# Altium schematic sheet 3_IO.SchDoc
size 383 x 325 mm; SheetNumber: 2; SheetTotal: 4
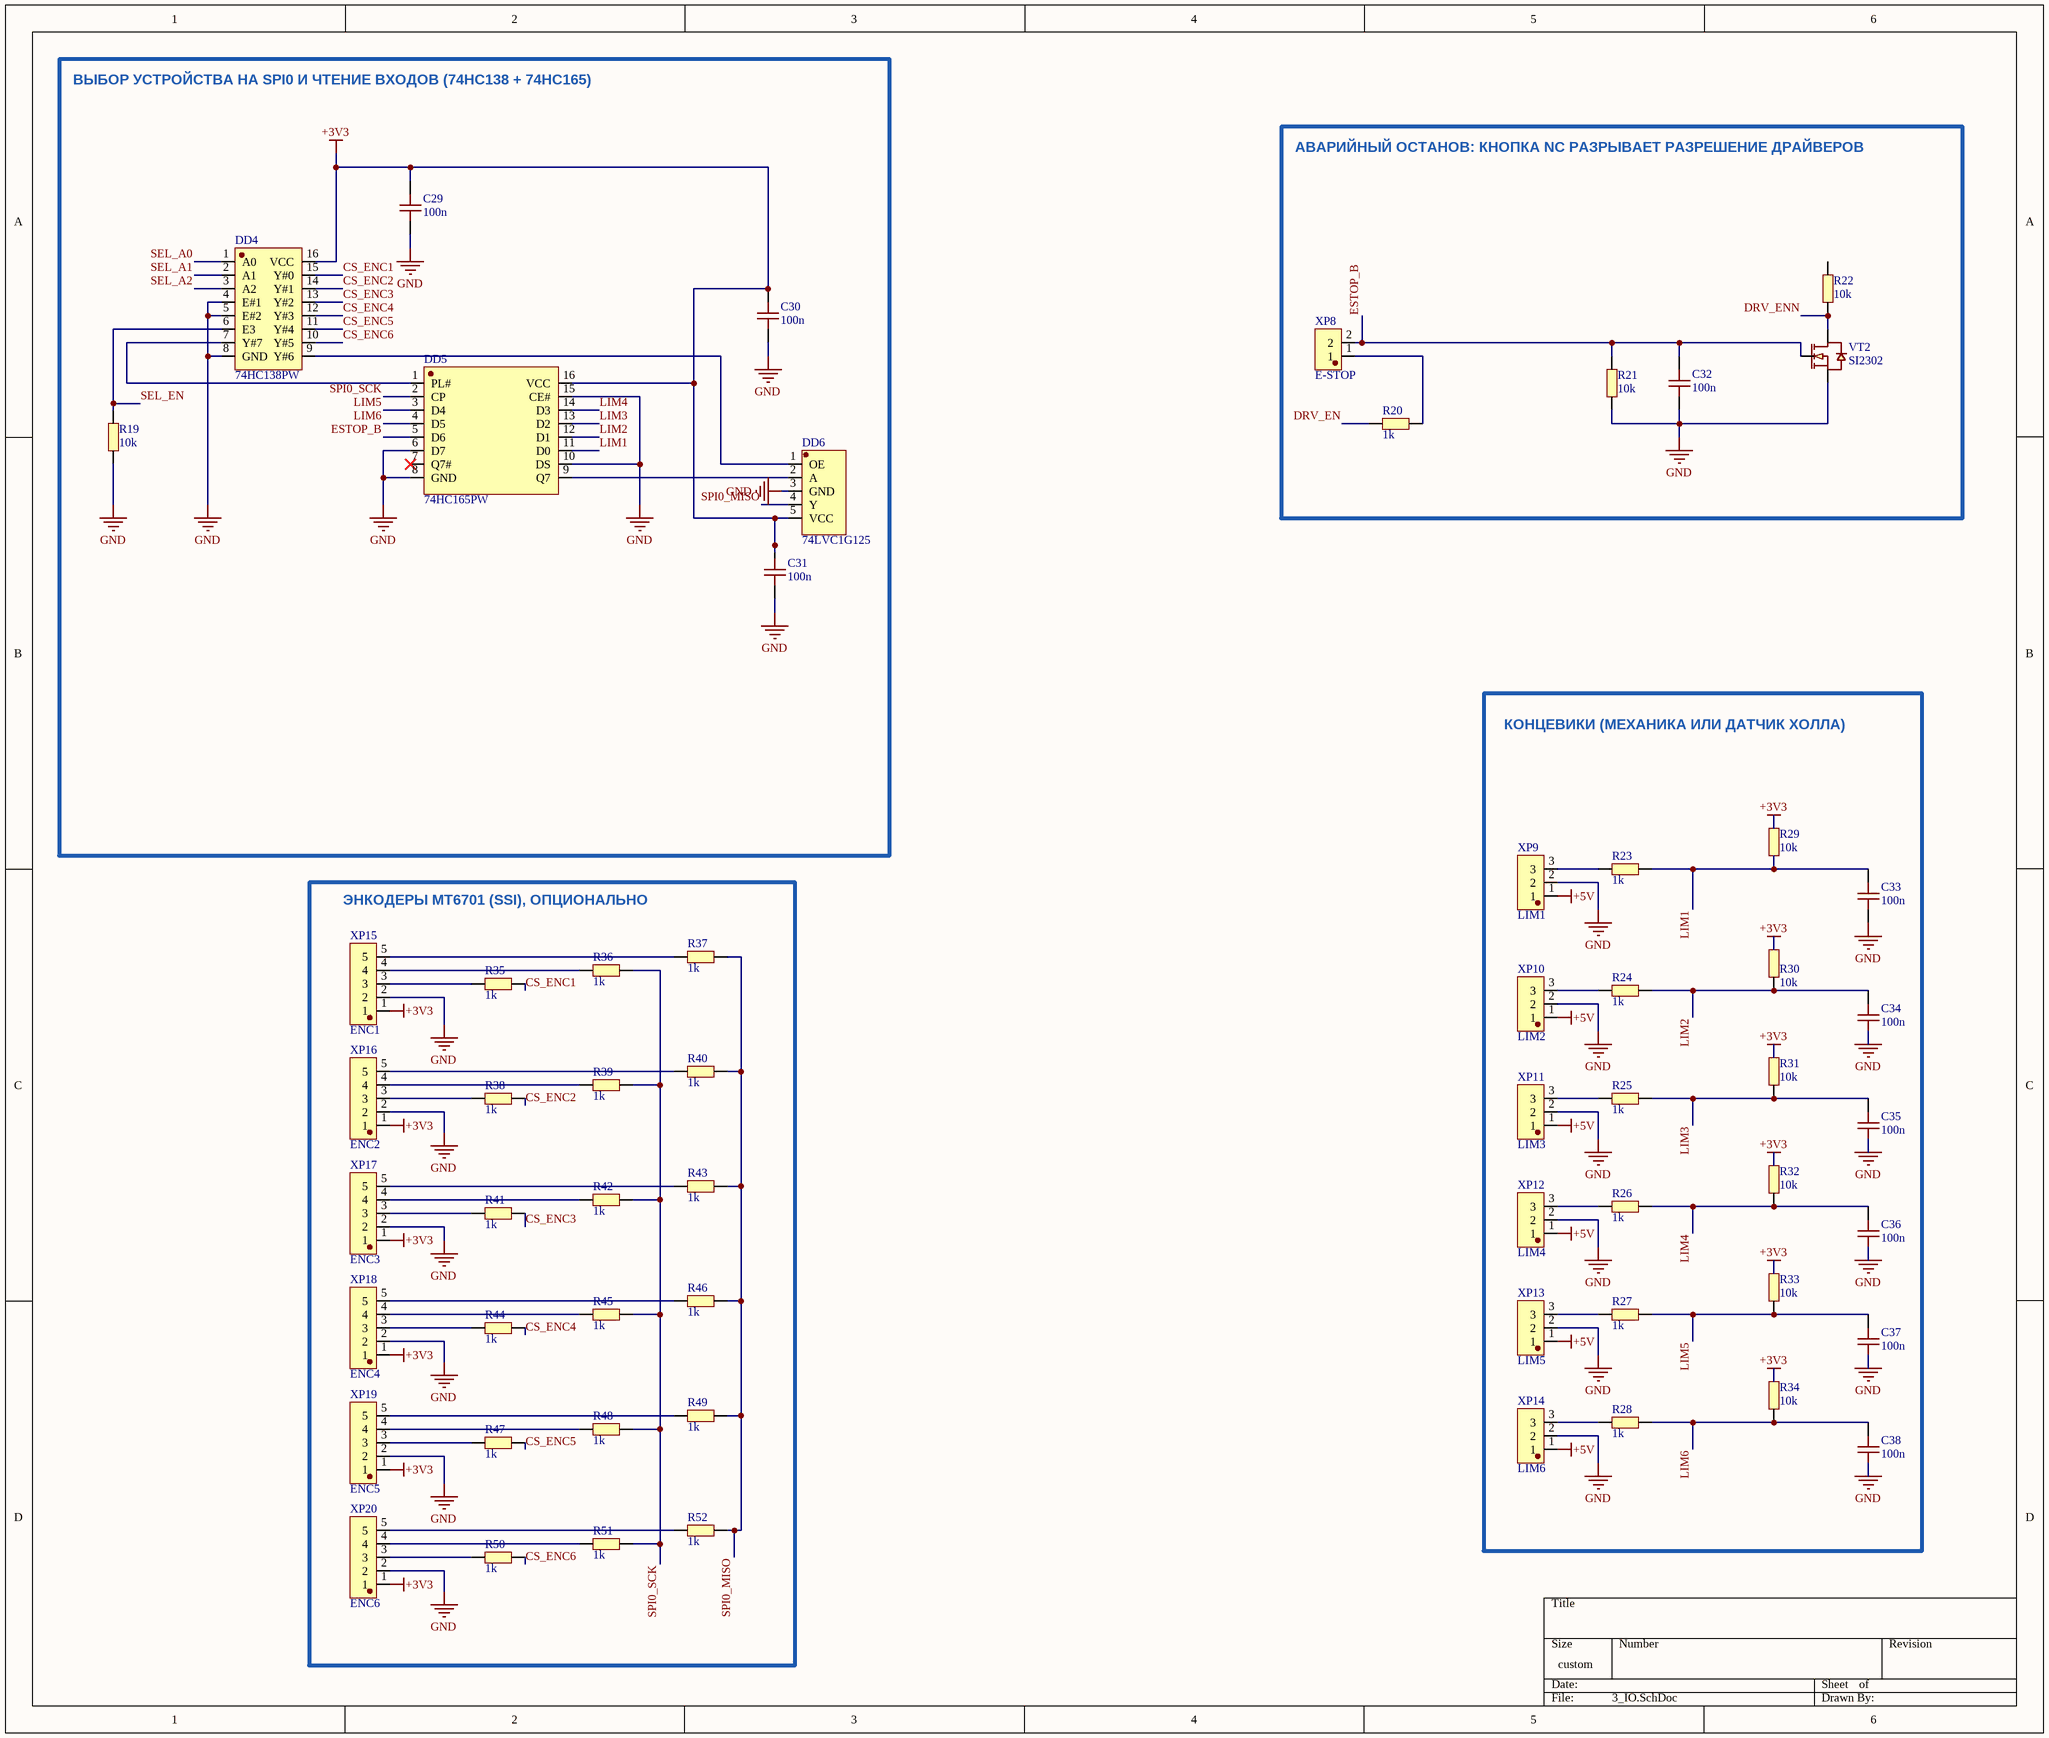
[diagram p0: 3_IO.SchDoc]

## Parts
C29  100n  [C0603]
C30  100n  [C0603]
C31  100n  [C0603]
C32  100n  [C0603]
C33  100n  [C0603]
C34  100n  [C0603]
C35  100n  [C0603]
C36  100n  [C0603]
C37  100n  [C0603]
C38  100n  [C0603]
DD4  74HC138PW  [TSSOP-16_L5.0-W4.4-P0.65-LS6.4-BL]
DD5  74HC165PW  [TSSOP-16_L5.0-W4.4-P0.65-LS6.4-BL]
DD6  74LVC1G125  [SOT-23-5_L3.0-W1.7-P0.95-LS2.8-BL]
R19  10k  [R0603]
R20  1k  [R0603]
R21  10k  [R0603]
R22  10k  [R0603]
R23  1k  [R0603]
R24  1k  [R0603]
R25  1k  [R0603]
R26  1k  [R0603]
R27  1k  [R0603]
R28  1k  [R0603]
R29  10k  [R0603]
R30  10k  [R0603]
R31  10k  [R0603]
R32  10k  [R0603]
R33  10k  [R0603]
R34  10k  [R0603]
R35  1k  [R0603]
R36  1k  [R0603]
R37  1k  [R0603]
R38  1k  [R0603]
R39  1k  [R0603]
R40  1k  [R0603]
R41  1k  [R0603]
R42  1k  [R0603]
R43  1k  [R0603]
R44  1k  [R0603]
R45  1k  [R0603]
R46  1k  [R0603]
R47  1k  [R0603]
R48  1k  [R0603]
R49  1k  [R0603]
R50  1k  [R0603]
R51  1k  [R0603]
R52  1k  [R0603]
VT2  SI2302  [SOT-23-3_L2.9-W1.3-P1.90-LS2.4-BR-CW]
XP8  E-STOP  [HDR-TH_2P-P2.54-V-M]
XP9  LIM1  [HDR-TH_3P-P2.54-V-M_PZ254V-11-03P]
XP10  LIM2  [HDR-TH_3P-P2.54-V-M_PZ254V-11-03P]
XP11  LIM3  [HDR-TH_3P-P2.54-V-M_PZ254V-11-03P]
XP12  LIM4  [HDR-TH_3P-P2.54-V-M_PZ254V-11-03P]
XP13  LIM5  [HDR-TH_3P-P2.54-V-M_PZ254V-11-03P]
XP14  LIM6  [HDR-TH_3P-P2.54-V-M_PZ254V-11-03P]
XP15  ENC1  [HDR-TH_5P-P2.54-V-M]
XP16  ENC2  [HDR-TH_5P-P2.54-V-M]
XP17  ENC3  [HDR-TH_5P-P2.54-V-M]
XP18  ENC4  [HDR-TH_5P-P2.54-V-M]
XP19  ENC5  [HDR-TH_5P-P2.54-V-M]
XP20  ENC6  [HDR-TH_5P-P2.54-V-M]

## Blocks framed on the sheet
ВЫБОР УСТРОЙСТВА НА SPI0 И ЧТЕНИЕ ВХОДОВ (74HC138 + 74HC165): C29-C31 DD4-DD6 R19
АВАРИЙНЫЙ ОСТАНОВ: КНОПКА NC РАЗРЫВАЕТ РАЗРЕШЕНИЕ ДРАЙВЕРОВ: C32 R20-R22 VT2 XP8
КОНЦЕВИКИ (МЕХАНИКА ИЛИ ДАТЧИК ХОЛЛА): C33-C38 R23-R34 XP9-XP14
ЭНКОДЕРЫ MT6701 (SSI), ОПЦИОНАЛЬНО: R35-R52 XP15-XP20

## Nets
+3V3: C29.1 C30.1 C31.1 DD4.16(VCC) DD5.16(VCC) DD6.5(VCC) R29.2 R30.2 R31.2 R32.2 R33.2 R34.2 XP15.1 XP16.1 XP17.1 XP18.1 XP19.1 XP20.1
+5V: XP9.1 XP10.1 XP11.1 XP12.1 XP13.1 XP14.1
GND: C29.2 C30.2 C31.2 C32.2 C33.2 C34.2 C35.2 C36.2 C37.2 C38.2 DD4.4(E#1) DD4.5(E#2) DD4.8(GND) DD5.6(D7) DD5.8(GND) DD5.10(DS) DD5.15(CE#) DD6.3(GND) R19.2 R21.2 VT2.3(S) XP9.2 XP10.2 XP11.2 XP12.2 XP13.2 XP14.2 XP15.2 XP16.2 XP17.2 XP18.2 XP19.2 XP20.2
CS_ENC1: DD4.15(Y#0) R35.2
CS_ENC2: DD4.14(Y#1) R38.2
CS_ENC3: DD4.13(Y#2) R41.2
CS_ENC4: DD4.12(Y#3) R44.2
CS_ENC5: DD4.11(Y#4) R47.2
CS_ENC6: DD4.10(Y#5) R50.2
DRV_EN: R20.1
DRV_ENN: R22.1 VT2.2(D)
ESTOP_B: C32.1 DD5.5(D6) R21.1 VT2.1(G) XP8.2
LIM1: C33.1 DD5.11(D0) R23.2 R29.1
LIM2: C34.1 DD5.12(D1) R24.2 R30.1
LIM3: C35.1 DD5.13(D2) R25.2 R31.1
LIM4: C36.1 DD5.14(D3) R26.2 R32.1
LIM5: C37.1 DD5.3(D4) R27.2 R33.1
LIM6: C38.1 DD5.4(D5) R28.2 R34.1
SEL_A0: DD4.1(A0)
SEL_A1: DD4.2(A1)
SEL_A2: DD4.3(A2)
SEL_EN: DD4.6(E3) R19.1
SPI0_MISO: DD6.4(Y) R37.2 R40.2 R43.2 R46.2 R49.2 R52.2
SPI0_SCK: DD5.2(CP) R36.2 R39.2 R42.2 R45.2 R48.2 R51.2
NetDD4_7: DD4.7(Y#7) DD5.1(PL#)
NetDD4_9: DD4.9(Y#6) DD6.1(OE)
NetDD5_9: DD5.9(Q7) DD6.2(A)
NetR20_2: R20.2 XP8.1
NetR23_1: R23.1 XP9.3
NetR24_1: R24.1 XP10.3
NetR25_1: R25.1 XP11.3
NetR26_1: R26.1 XP12.3
NetR27_1: R27.1 XP13.3
NetR28_1: R28.1 XP14.3
NetR35_1: R35.1 XP15.3
NetR36_1: R36.1 XP15.4
NetR37_1: R37.1 XP15.5
NetR38_1: R38.1 XP16.3
NetR39_1: R39.1 XP16.4
NetR40_1: R40.1 XP16.5
NetR41_1: R41.1 XP17.3
NetR42_1: R42.1 XP17.4
NetR43_1: R43.1 XP17.5
NetR44_1: R44.1 XP18.3
NetR45_1: R45.1 XP18.4
NetR46_1: R46.1 XP18.5
NetR47_1: R47.1 XP19.3
NetR48_1: R48.1 XP19.4
NetR49_1: R49.1 XP19.5
NetR50_1: R50.1 XP20.3
NetR51_1: R51.1 XP20.4
NetR52_1: R52.1 XP20.5

Not connected (* = marked no-connect by the designer): DD5 7(Q7#)*; R22 2

## Library data of the parts
C29-C38 = CL10B104KB8NNNC/0603: Manufacturer Part Number: CL10B104KB8NNNC/0603; LCSC Part: C9900007620; Supplier: LCSC; Supplier Part Number: C9900007620; Datasheet: https://www.lcsc.com/datasheet/C9900007620.pdf; Source: JLCEDA/EasyEDA Official Library (https://easyeda.com, https://lceda.cn)
DD4 = 74HC138PW-Q100,118: Manufacturer: Nexperia; Manufacturer Part Number: 74HC138PW-Q100,118; LCSC Part: C546575; Supplier: LCSC; Supplier Part Number: C546575; JLCPCB Part Class: Extended Part; Datasheet: https://www.lcsc.com/datasheet/C546575.pdf; LCSC URL: https://lcsc.com/product-detail/presales_Nexperia-74HC138PW-Q100-118_C546575.html; Source: JLCEDA/EasyEDA Official Library (https://easyeda.com, https://lceda.cn)
DD5 = 74HC165PW,118: Manufacturer: Nexperia; Manufacturer Part Number: 74HC165PW,118; LCSC Part: C80696; Supplier: LCSC; Supplier Part Number: C80696; JLCPCB Part Class: Extended Part; Datasheet: https://www.lcsc.com/datasheet/C80696.pdf; LCSC URL: https://lcsc.com/product-detail/74-Series_NXP_74HC165PW_74HC165PW_C80696.html; Source: JLCEDA/EasyEDA Official Library (https://easyeda.com, https://lceda.cn)
DD6 = SN74LVC1G125DBVR: Manufacturer: TI; Manufacturer Part Number: SN74LVC1G125DBVR; LCSC Part: C23654; Supplier: LCSC; Supplier Part Number: C23654; JLCPCB Part Class: Extended Part; Datasheet: https://www.lcsc.com/datasheet/C23654.pdf; LCSC URL: https://lcsc.com/product-detail/74-Series_TI_SN74LVC1G125DBVR_SN74LVC1G125DBVR_C23654.html; Source: JLCEDA/EasyEDA Official Library (https://easyeda.com, https://lceda.cn)
R19-R52 = 0603WAF1002T5E: 10KOhm (1002) ±1%; Manufacturer: UNI-ROYAL; Value: 10kΩ; Manufacturer Part Number: 0603WAF1002T5E; LCSC Part: C25804; Supplier: LCSC; Supplier Part Number: C25804; JLCPCB Part Class: Basic Part; Datasheet: https://www.lcsc.com/datasheet/C25804.pdf; LCSC URL: https://lcsc.com/product-detail/Chip-Resistor-Surface-Mount-UniOhm_10KR-1002-1_C25804.html; Source: JLCEDA/EasyEDA Official Library (https://easyeda.com, https://lceda.cn)
VT2 = SI2302DDS-T1-GE3-HXY: Manufacturer: HXY MOSFET; Manufacturer Part Number: Si2302DDS-T1-GE3-HXY; LCSC Part: C22367242; Supplier: LCSC; Supplier Part Number: C22367242; JLCPCB Part Class: Extended Part; Datasheet: https://www.lcsc.com/datasheet/C22367242.pdf; Source: JLCEDA/EasyEDA Official Library (https://easyeda.com, https://lceda.cn)
XP8 = PZ254V-11-02P: Manufacturer: XFCN; Manufacturer Part Number: PZ254V-11-02P; LCSC Part: C492401; Supplier: LCSC; Supplier Part Number: C492401; JLCPCB Part Class: Extended Part; Datasheet: https://www.lcsc.com/datasheet/C492401.pdf; LCSC URL: https://lcsc.com/product-detail/New-Arrivals_XFCN-PZ254V-11-02P_C492401.html; Source: JLCEDA/EasyEDA Official Library (https://easyeda.com, https://lceda.cn)
XP9-XP14 = PZ254V-11-03P_C2937625: Manufacturer: XFCN; Manufacturer Part Number: PZ254V-11-03P; LCSC Part: C2937625; Supplier: LCSC; Supplier Part Number: C2937625; JLCPCB Part Class: Extended Part; Datasheet: https://www.lcsc.com/datasheet/C2937625.pdf; Source: JLCEDA/EasyEDA Official Library (https://easyeda.com, https://lceda.cn)
XP15-XP20 = PZ254V-11-05P: Manufacturer: XFCN; Manufacturer Part Number: PZ254V-11-05P; LCSC Part: C492404; Supplier: LCSC; Supplier Part Number: C492404; JLCPCB Part Class: Extended Part; Datasheet: https://www.lcsc.com/datasheet/C492404.pdf; LCSC URL: https://lcsc.com/product-detail/New-Arrivals_XFCN-PZ254V-11-05P_C492404.html; Source: JLCEDA/EasyEDA Official Library (https://easyeda.com, https://lceda.cn)